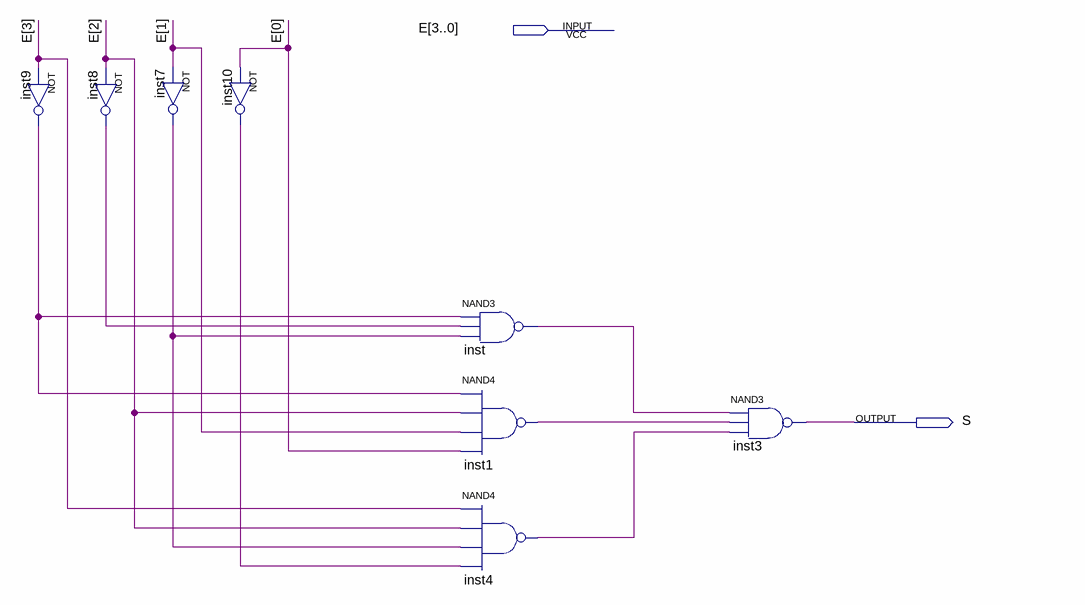
[diagram p0: schematic sheet]
// Quartus schematic S_G.bdf as structural Verilog: 8 symbols, 2 pins
module S_G (
  input  [3:0] E,
  output S
);

  wire inst1_out, inst4_out, inst7_out, inst8_out, inst9_out, inst10_out, inst_out;

  not inst8 (inst8_out, E[2]);
  not inst9 (inst9_out, E[3]);
  not inst7 (inst7_out, E[1]);
  not inst10 (inst10_out, E[0]);
  nand inst (inst_out, inst9_out, inst8_out, inst7_out);
  nand inst1 (inst1_out, inst9_out, E[2], E[1], E[0]);
  nand inst4 (inst4_out, E[3], E[2], inst7_out, inst10_out);
  nand inst3 (S, inst_out, inst1_out, inst4_out);
endmodule
